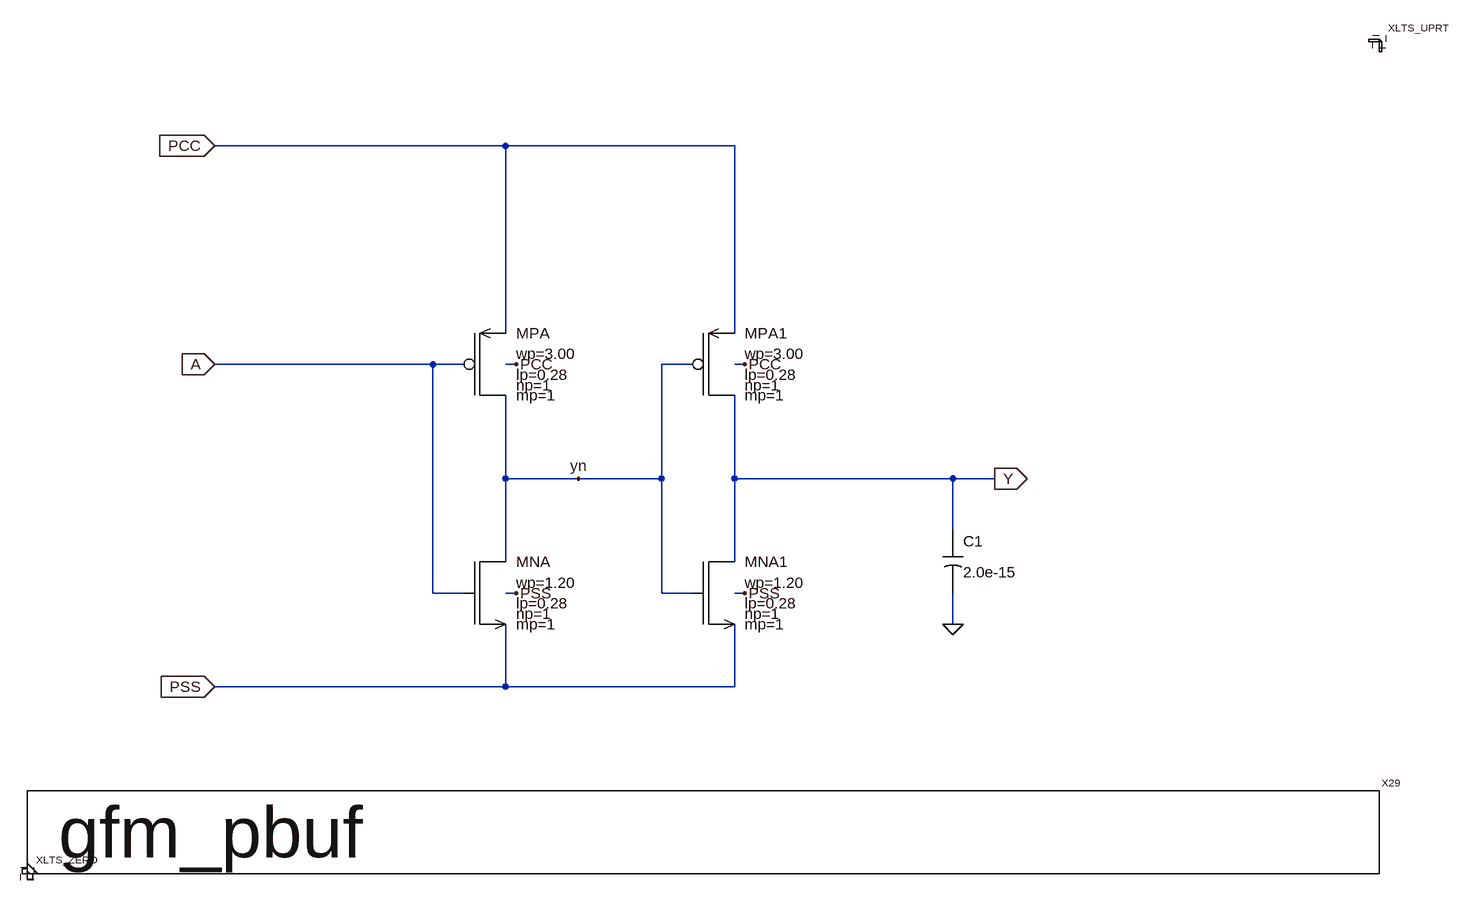
[diagram p0: schematic gfm_pbuf.asc]
gfm_pbuf.asc, the LTspice schematic file:
Version 4
SHEET 1 4552 4336
WIRE 736 -1120 288 -1120
WIRE 1088 -1120 736 -1120
WIRE 736 -832 736 -1120
WIRE 1088 -832 1088 -1120
WIRE 624 -784 288 -784
WIRE 672 -784 624 -784
WIRE 752 -784 736 -784
WIRE 1024 -784 976 -784
WIRE 1104 -784 1088 -784
WIRE 736 -608 736 -736
WIRE 848 -608 736 -608
WIRE 976 -608 976 -784
WIRE 976 -608 848 -608
WIRE 1088 -608 1088 -736
WIRE 1424 -608 1088 -608
WIRE 1488 -608 1424 -608
WIRE 1424 -528 1424 -608
WIRE 736 -480 736 -608
WIRE 1088 -480 1088 -608
WIRE 624 -432 624 -784
WIRE 672 -432 624 -432
WIRE 752 -432 736 -432
WIRE 976 -432 976 -608
WIRE 1024 -432 976 -432
WIRE 1104 -432 1088 -432
WIRE 1424 -384 1424 -432
WIRE 736 -288 736 -384
WIRE 736 -288 288 -288
WIRE 1088 -288 1088 -384
WIRE 1088 -288 736 -288
FLAG 288 -288 PSS
IOPIN 288 -288 In
FLAG 288 -784 A
IOPIN 288 -784 In
FLAG 288 -1120 PCC
IOPIN 288 -1120 In
FLAG 1488 -608 Y
IOPIN 1488 -608 Out
FLAG 1424 -384 0
FLAG 752 -784 PCC
FLAG 752 -432 PSS
FLAG 1104 -784 PCC
FLAG 1104 -432 PSS
FLAG 848 -608 yn
SYMBOL BD_GTitleLTS 0 0 R0
SYMATTR InstName X29
SYMATTR SpiceModel gfm_pbuf
SYMBOL gcap 1424 -528 R0
SYMATTR InstName C1
SYMATTR Value 2.0e-15
SYMBOL gfmcu_pmos3p3 672 -784 R0
SYMATTR InstName MPA
SYMATTR Value wp=3.00
SYMATTR Value2 lp=0.28
SYMBOL gfmcu_nmos3p3 672 -432 R0
SYMATTR InstName MNA
SYMATTR Value wp=1.20
SYMATTR Value2 lp=0.28
SYMBOL gfmcu_pmos3p3 1024 -784 R0
SYMATTR InstName MPA1
SYMATTR Value wp=3.00
SYMATTR Value2 lp=0.28
SYMBOL gfmcu_nmos3p3 1024 -432 R0
SYMATTR InstName MNA1
SYMATTR Value wp=1.20
SYMATTR Value2 lp=0.28
SYMBOL BD_ZERO 0 0 R0
SYMATTR InstName XLTS_ZERO
SYMBOL BD_UPRT 2080 -1280 R0
SYMATTR InstName XLTS_UPRT

The netlist it stands for:
* gfm_pbuf.asc
XX29 BD_GTitleLTS
C1 Y 0 2.0e-15
XMPA yn A PCC PCC gfmcu_pmos3p3 wp=3.00 lp=0.28 np=1 mp=1  ; pins ND NG NS NB
XMNA yn A PSS PSS gfmcu_nmos3p3 wp=1.20 lp=0.28 np=1 mp=1  ; pins ND NG NS NB
XMPA1 Y yn PCC PCC gfmcu_pmos3p3 wp=3.00 lp=0.28 np=1 mp=1  ; pins ND NG NS NB
XMNA1 Y yn PSS PSS gfmcu_nmos3p3 wp=1.20 lp=0.28 np=1 mp=1  ; pins ND NG NS NB
XXLTS_ZERO BD_ZERO
XXLTS_UPRT BD_UPRT
.lib dmodels_analog.lib
.lib models_gfmcu.lib
.backanno
.end